# Altium schematic sheet PFC-Sheet-ch3.SchDoc (part 1 of 3)
size 420 x 297 mm; SheetNumber: 4; SheetTotal: 10
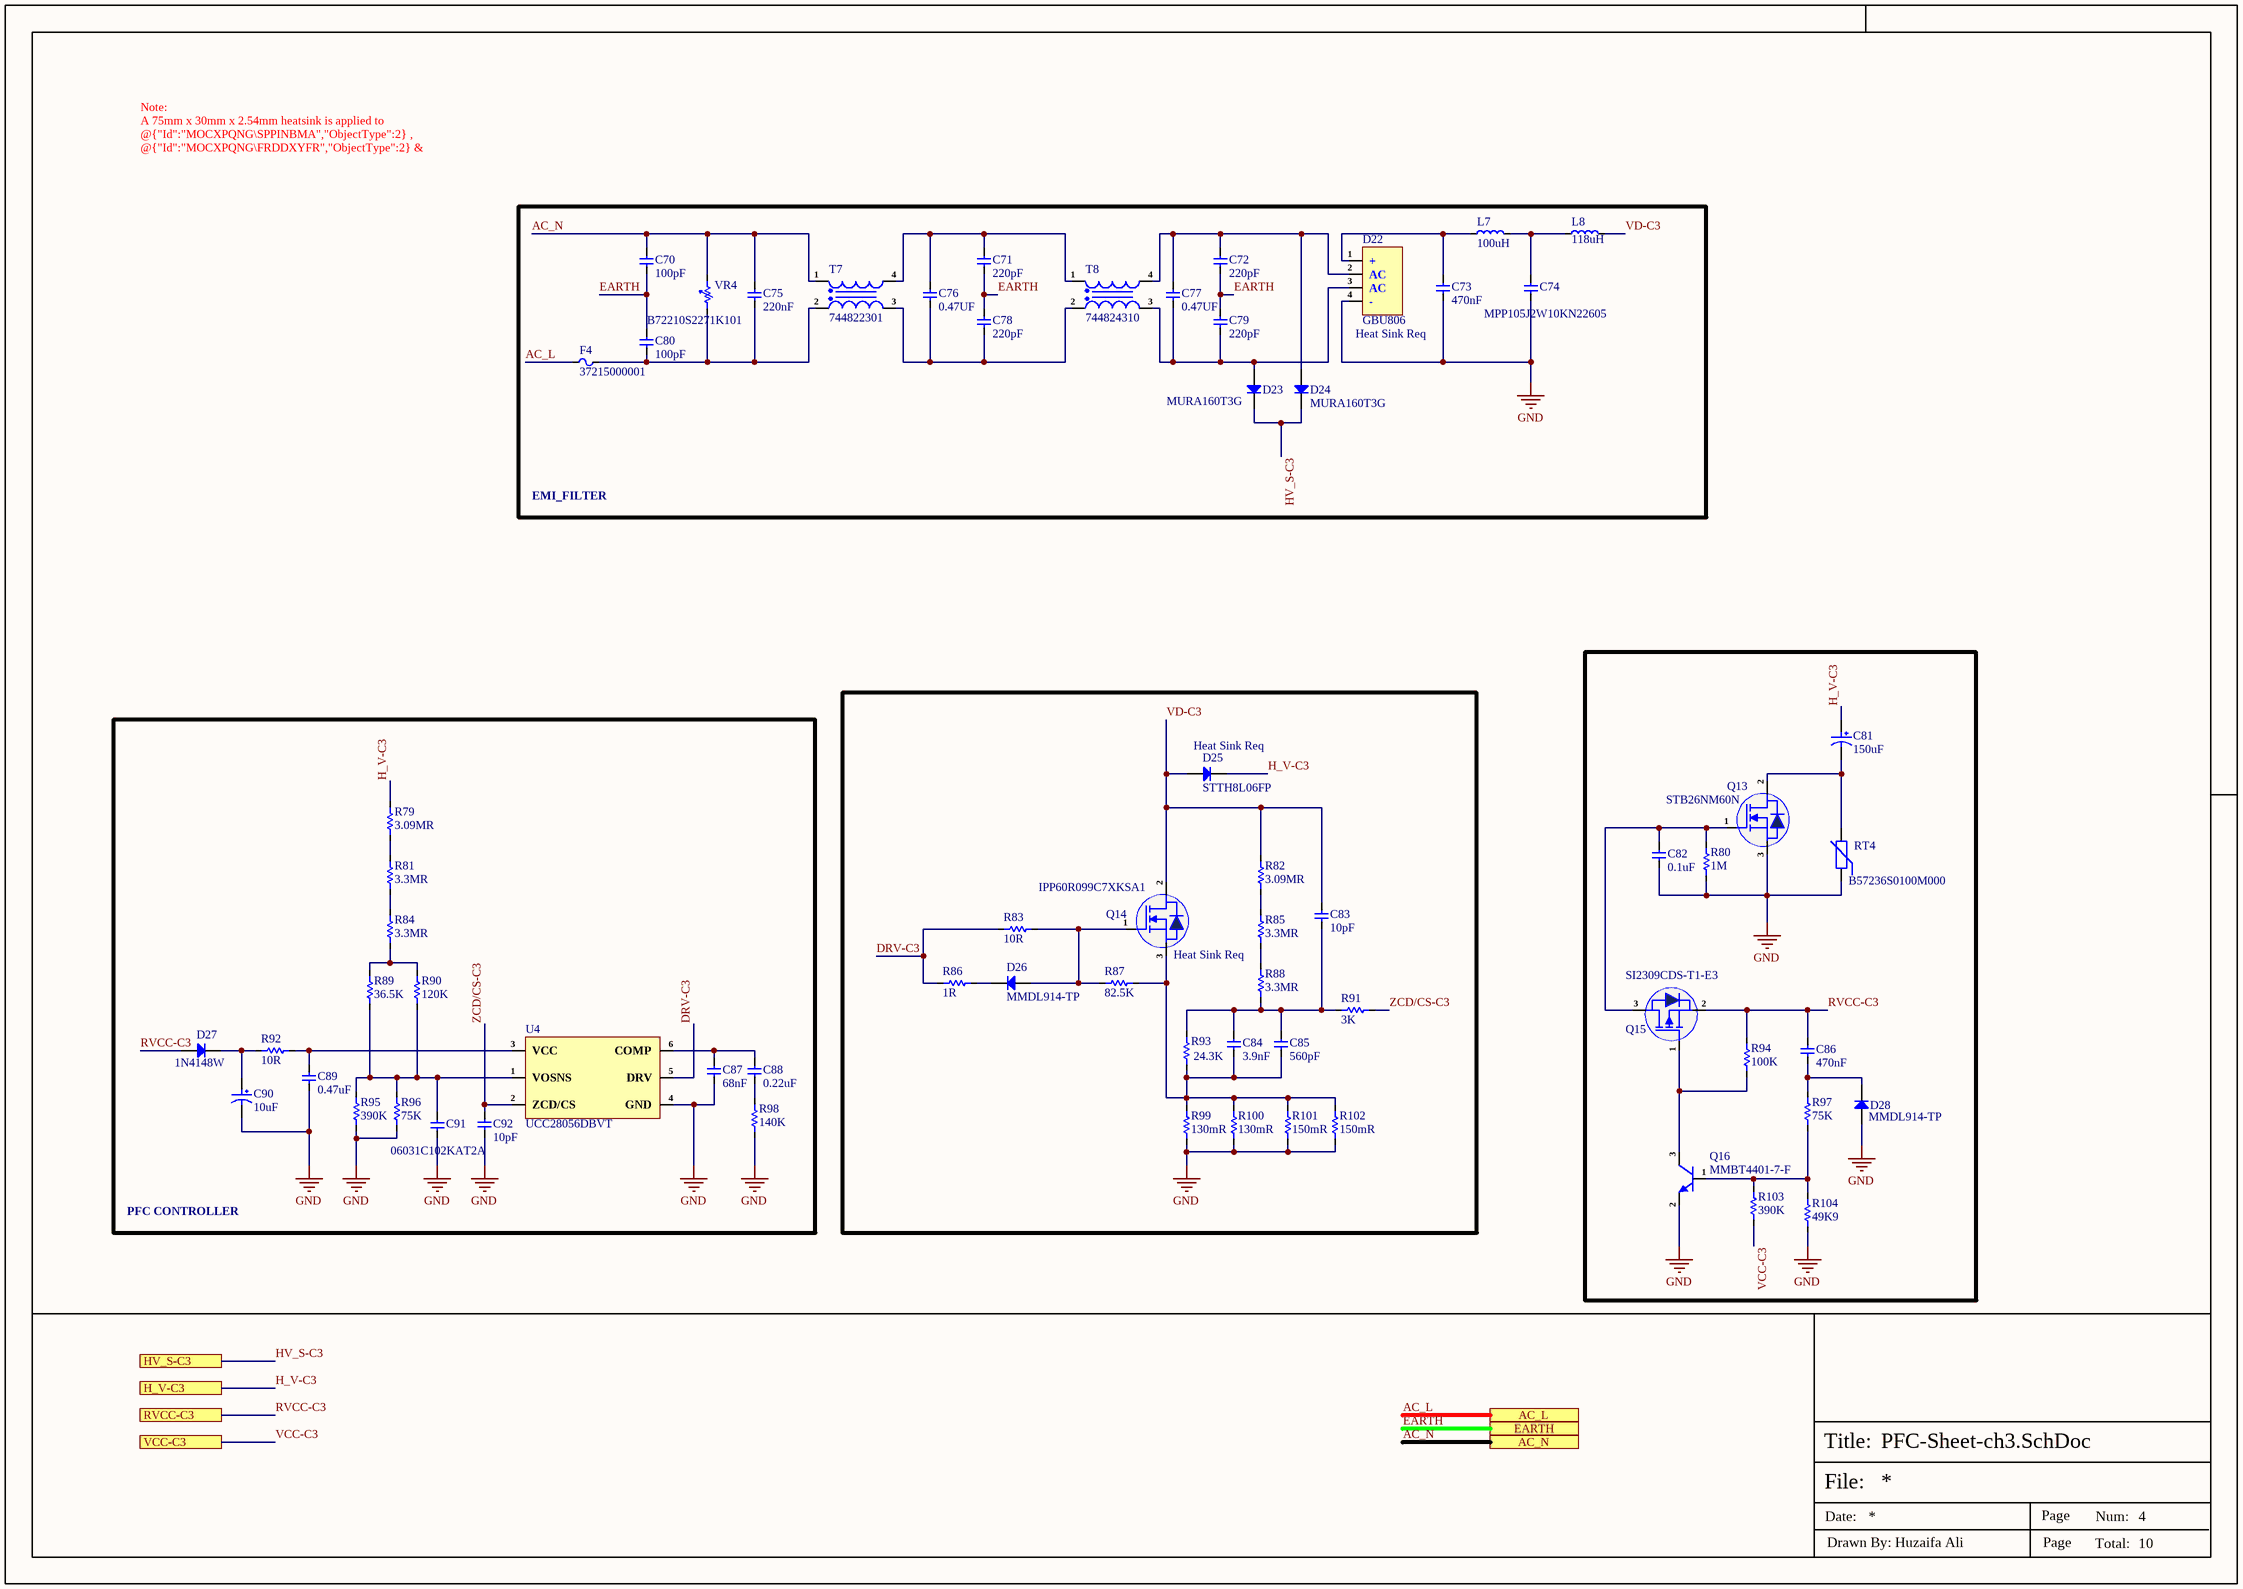
[diagram p0: PFC-Sheet-ch3.SchDoc]

## Parts
C70  100pF  [DE1B3RA101KN4AN01F]
C71  220pF  [DE1B3RA221KN4AN01F]
C72  220pF  [DE1B3RA221KN4AN01F]
C73  470nF  [450MPK474J]
C74  MPP105J2W10KN22605  [MPP105J2W10KN22605]
C75  220nF  [X2P2224KN1B0130150080ES0]
C76  0.47UF  [890324024005]
C77  0.47UF  [890324024005]
C78  220pF  [DE1B3RA221KN4AN01F]
C79  220pF  [DE1B3RA221KN4AN01F]
C80  100pF  [DE1B3RA101KN4AN01F]
C81  150uF  [KN151M45025*30A]
C82  0.1uF  [Cap-0603]
C83  10pF  [Cap-1206]
C84  3.9nF  [Cap-0603]
C85  560pF  [Cap-0603]
C86  470nF  [Cap-1206]
C87  68nF  [Cap-0603]
C88  0.22uF  [Cap-0603]
C89  0.47uF  [Cap-1206]
C90  10uF  [50SVPF10M]
C91  06031C102KAT2A  [Cap-0603]
C92  10pF  [Cap-0603]
D22  GBU806  [GBU]
D23  MURA160T3G  [SMA]
D24  MURA160T3G  [SMA]
D25  STTH8L06FP  [TO-220-2]
D26  MMDL914-TP  [SOD-323]
D27  1N4148W  [SOD-123]
D28  MMDL914-TP  [SOD-323]
F4  37215000001  [37215000001]
L7  100uH  [7447021]
L8  118uH  [760801401]
Q13  STB26NM60N  [TO-263]
Q14  IPP60R099C7XKSA1  [TO-220-3]
Q15  SI2309CDS-T1-E3  [SOT-23]
Q16  MMBT4401-7-F  [SOT-23]
R79  3.09MR  [Res-1206]
R80  1M  [RES-0805]
R81  3.3MR  [Res-1206]
R82  3.09MR  [Res-1206]
R83  10R  [Res-0603]
R84  3.3MR  [Res-1206]
R85  3.3MR  [Res-1206]
R86  1R  [Res-0603]
R87  82.5K  [Res-0603]
R88  3.3MR  [Res-1206]
R89  36.5K  [Res-0603]
R90  120K  [Res-0603]
R91  3K  [Res-0603]
R92  10R  [RES-0805]
R93  24.3K  [Res-0603]
R94  100K  [Res-0603]
R95  390K  [Res-0603]
R96  75K  [Res-0603]
R97  75K  [Res-0603]
R98  140K  [Res-0603]
R99  130mR  [Res-1206]
R100  130mR  [Res-1206]
R101  150mR  [Res-1206]
R102  150mR  [Res-1206]
R103  390K  [Res-0603]
R104  49K9  [Res-0603]
RT4  B57236S0100M000  [B57236S0100M000]
T7  744822301  [744822301]
T8  744824310  [744824310]
U4  UCC28056DBVT  [SOT-23-6]
VR4  B72210S2271K101  [B72210S2271K101]

## Blocks framed on the sheet
PFC CONTROLLER: C87-C92 D27 R79 R81 R84 R89 R90 R92 R95 R96 R98 U4

## Ports
AC_L (see Top-Sheet[1B], Connector-Sheet[5D], PFC-Sheet-ch2[4D], PFC-Sheet-ch4[4D], PFC-Sheet[4D]), AC_N (see Top-Sheet[1B], Connector-Sheet[5D], PFC-Sheet-ch2[4D], PFC-Sheet-ch4[4D], PFC-Sheet[4D]), EARTH (see Top-Sheet[1B], Connector-Sheet[5D], PFC-Sheet-ch2[4D], PFC-Sheet-ch4[4D], PFC-Sheet[4D]), H_V-C3 (see Top-Sheet[2B], Power_Controller-Sheet-ch3[4D]), HV_S-C3 (see Top-Sheet[2B], Power_Controller-Sheet-ch3[4D]), RVCC-C3 (see Top-Sheet[2B], Power_Controller-Sheet-ch3[4D]), VCC-C3 (see Top-Sheet[2C], Power_Controller-Sheet-ch3[4D])

## Nets
GND: C73.1 C74.1 C82.1 C87.1 C89.1 C90.2 C91.1 C92.2 D22.4(-) D28.2(A) Q13.3(S) Q16.2(E) R80.1 R95.1 R96.1 R98.1 R99.2 R100.2 R101.1 R102.1 R104.1 RT4.1 U4.4(GND)
AC_L: F4.1 ; port AC_L
AC_N: C70.2 C75.2 T7.1 VR4.2 ; port AC_N
DRV-C3: R83.1 R86.1 U4.5(DRV)
EARTH: C70.1 C71.1 C72.1 C78.2 C79.2 C80.2 ; port EARTH
H_V-C3: C81.1 D25.1(K) R79.2 ; port H_V-C3
HV_S-C3: D23.1(K) D24.1(K) ; port HV_S-C3
RVCC-C3: C86.2 D27.1(A) Q15.2(S) R94.2 ; port RVCC-C3
VCC-C3: R103.1 ; port VCC-C3
VD-C3: C83.2 D25.2(A) L8.2 Q14.2(D) R82.2
ZCD/CS-C3: C92.1 R91.2 U4.2(ZCD/CS)
NetC71_2: C71.2 C76.2 T7.4 T8.1
NetC72_2: C72.2 C77.2 D22.2(AC) D24.2(A) T8.4
NetC73_2: C73.2 D22.1(+) L7.1
NetC74_2: C74.2 L7.2 L8.1
NetC75_1: C75.1 C80.1 F4.2 T7.2 VR4.1
NetC76_1: C76.1 C78.1 T7.3 T8.2
NetC77_1: C77.1 C79.1 D22.3(AC) D23.2(A) T8.3
NetC81_2: C81.2 Q13.2(D) RT4.2
NetC82_2: C82.2 Q13.1(G) Q15.3(D) R80.2
NetC83_1: C83.1 C84.2 C85.2 R88.1 R91.1 R93.2
NetC84_1: C84.1 C85.1 Q14.3(S) R87.2 R93.1 R99.1 R100.1 R101.2 R102.2
NetC86_1: C86.1 D28.1(K) R97.2
NetC87_2: C87.2 C88.2 U4.6(COMP)
NetC88_1: C88.1 R98.2
NetC89_2: C89.2 R92.2 U4.3(VCC)
NetC90_1: C90.1 D27.2(K) R92.1
NetC91_2: C91.2 R89.1 R90.1 R95.2 R96.2 U4.1(VOSNS)
NetD26_1: D26.1(K) R86.2
NetD26_2: D26.2(A) Q14.1(G) R83.2 R87.1
NetQ15_1: Q15.1(G) Q16.3(C) R94.1
NetQ16_1: Q16.1(B) R97.1 R103.2 R104.2
NetR79_1: R79.1 R81.2
NetR81_1: R81.1 R84.2
NetR82_1: R82.1 R85.2
NetR84_1: R84.1 R89.2 R90.2
NetR85_1: R85.1 R88.2

## Notes on the sheet
- Note:
  A 75mm x 30mm x 2.54mm heatsink is applied to @{"Id":"MOCXPQNG\SPPINBMA","ObjectType":2} , @{"Id":"MOCXPQNG\FRDDXYFR","ObjectType":2} & @{"Id":"MOCXPQNG\YJVBHGNF","ObjectType":2}
- Heat Sink Req
- EMI_FILTER
- (near D25) Heat Sink Req
- File:
- Title:
- Date:
- Page
- Num:
- Total:
- Drawn By: Huzaifa Ali